# Altium schematic sheet CO2_Sensor.SchDoc
size A; SheetNumber: 8; SheetTotal: 9
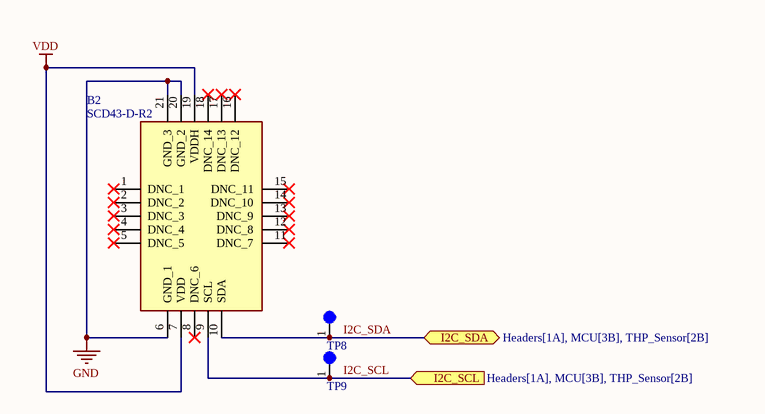
[diagram p0: CO2_Sensor.SchDoc]

## Parts
B2  SCD43-D-R2  [SCD43DR2]
TP8  5003  [TEST-POINT-0001]  (value not drawn)
TP9  5003  [TEST-POINT-0001]  (value not drawn)

## Ports
I2C_SCL (in, see Headers[1A], MCU[3B], THP_Sensor[2B]), I2C_SDA (bidir, see Headers[1A], MCU[3B], THP_Sensor[2B])

## Nets
GND: B2.6(GND_1) B2.20(GND_2) B2.21(GND_3)
VDD: B2.7(VDD) B2.19(VDDH)
I2C_SCL: B2.9(SCL) TP9.1 ; port I2C_SCL
I2C_SDA: B2.10(SDA) TP8.1 ; port I2C_SDA

Not connected (* = marked no-connect by the designer): B2 1(DNC_1)* 2(DNC_2)* 3(DNC_3)* 4(DNC_4)* 5(DNC_5)* 8(DNC_6)* 11(DNC_7)* 12(DNC_8)* 13(DNC_9)* 14(DNC_10)* 15(DNC_11)* 16(DNC_12)* 17(DNC_13)* 18(DNC_14)*

## Library data of the parts
B2 = SCD43-D-R2: Carbon Dioxide (CO2) Sensor Voltage 2.4V ~ 5.5V , 205mA , 400 kHz  -10C ~ 60C; Manufacturer_Name: Sensirion; Geometry.Height: 6.8mm; Manufacturer_Part_Number: SCD43-D-R2; Mouser Part Number: *; Mouser Price/Stock: *; Arrow Part Number: *; Arrow Price/Stock: *; Datasheet Link: https://sensirion.com/media/documents/48C4B7FB/67FE0194/CD_DS_SCD4x_Datasheet_D1.pdf
TP8 TP9 = TEST-POINT-0001: Oranange PC Test Point, Miniature Phoisphor Bronze Silver Plating Through Hole Mounting Type